# Altium project LattePanda.PrjPcb (part 2 of 2)
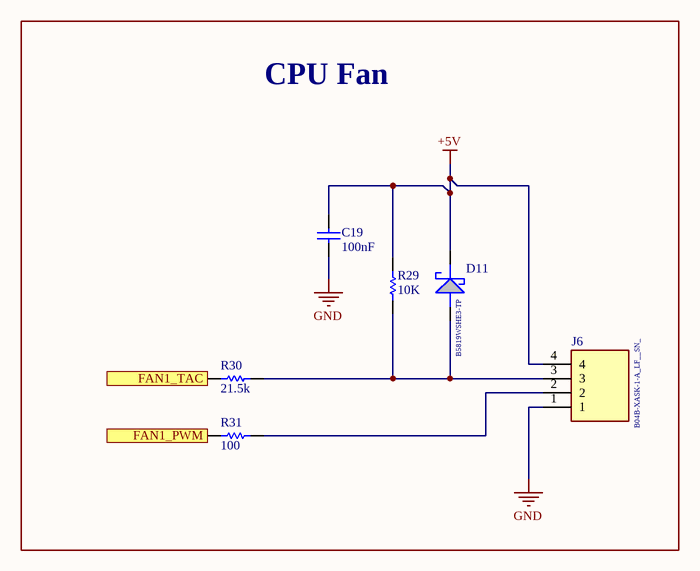
[diagram p9: [3] Fan.SchDoc]

## Nets that join several sheets
+3V3: [1] Conn_SODIMM (10 pins), [2] Power_Supply (7 pins), [5] Ethernet (12 pins), [7] Mini_HDMI (Q5.1 R49.1 R50.1 R51.1), [8] Sockets (11 pins)
+5V: [2] Power_Supply (6 pins), [6] USB (8 pins), [7] Mini_HDMI (C52.2 D12.2 F5.2), [3] Fan (C19.2 D11.1 J6.4 R29.2)
+VCC: [1] Conn_SODIMM (J3.250), [2] Power_Supply (13 pins)
GND: [1] Conn_SODIMM (7 pins), [2] Power_Supply (43 pins), [5] Ethernet (19 pins), [6] USB (25 pins), [7] Mini_HDMI (14 pins), [8] Sockets (11 pins), [3] Fan (C19.1 J6.1)
NetC30_2: [1] Conn_SODIMM (J3.63), [5] Ethernet (C30.2)
NetC31_2: [1] Conn_SODIMM (J3.61), [5] Ethernet (C31.2)
NetC32_2: [1] Conn_SODIMM (J3.66), [5] Ethernet (C32.2)
NetC33_2: [1] Conn_SODIMM (J3.64), [5] Ethernet (C33.2)
NetC57_2: [1] Conn_SODIMM (J3.31), [8] Sockets (C57.2)
NetC58_2: [1] Conn_SODIMM (J3.33), [8] Sockets (C58.2)
NetC59_2: [1] Conn_SODIMM (J3.25), [8] Sockets (C59.2)
NetC60_2: [1] Conn_SODIMM (J3.27), [8] Sockets (C60.2)
NetJ3_2: [1] Conn_SODIMM (J3.2), [3] Fan (R31.1)
NetJ3_4: [1] Conn_SODIMM (J3.4), [3] Fan (R30.1)
NetJ3_28: [1] Conn_SODIMM (J3.28), [8] Sockets (J11.43)
NetJ3_30: [1] Conn_SODIMM (J3.30), [8] Sockets (J11.41)
NetJ3_34: [1] Conn_SODIMM (J3.34), [8] Sockets (J12.41)
NetJ3_36: [1] Conn_SODIMM (J3.36), [8] Sockets (J12.43)
NetJ3_76: [1] Conn_SODIMM (J3.76), [8] Sockets (J12.3)
NetJ3_78: [1] Conn_SODIMM (J3.78), [8] Sockets (J12.5)
NetJ3_85: [1] Conn_SODIMM (J3.85), [8] Sockets (J11.55)
NetJ3_87: [1] Conn_SODIMM (J3.87), [8] Sockets (J11.53)
NetJ3_88: [1] Conn_SODIMM (J3.88), [8] Sockets (J12.47)
NetJ3_90: [1] Conn_SODIMM (J3.90), [8] Sockets (J12.49)
NetJ3_94: [1] Conn_SODIMM (J3.94), [5] Ethernet (U11.15)
NetJ3_96: [1] Conn_SODIMM (J3.96), [5] Ethernet (U11.16)
NetJ3_131: [1] Conn_SODIMM (J3.131), [8] Sockets (R60.1)
NetJ3_169: [1] Conn_SODIMM (J3.169), [7] Mini_HDMI (Q4.3 R49.2)
NetJ3_171: [1] Conn_SODIMM (J3.171), [7] Mini_HDMI (Q3.3 R50.2)
NetJ3_183: [1] Conn_SODIMM (J3.183), [7] Mini_HDMI (Q5.3 R51.2)
PLTRST: [1] Conn_SODIMM (J3.105), [5] Ethernet (U11.19), [8] Sockets (J11.50 J12.52)
PWR_LED/PSON: [1] Conn_SODIMM (J3.5), [2] Power_Supply (R20.2), [7] Mini_HDMI (R46.1)
PWR_SW: [1] Conn_SODIMM (J3.1), [2] Power_Supply (R27.2)
RST_SW: [1] Conn_SODIMM (J3.3), [2] Power_Supply (R28.2)
STDA_SSRX1_N: [1] Conn_SODIMM (J3.18), [6] USB (J8.5 U14.1)
STDA_SSRX1_P: [1] Conn_SODIMM (J3.16), [6] USB (J8.6 U14.2)
STDA_SSRX2_N: [1] Conn_SODIMM (J3.24), [6] USB (J8.14 U14.4)
STDA_SSRX2_P: [1] Conn_SODIMM (J3.22), [6] USB (J8.15 U14.5)
TMD_CK_N: [1] Conn_SODIMM (J3.197), [7] Mini_HDMI (C51.2)
TMD_CK_P: [1] Conn_SODIMM (J3.199), [7] Mini_HDMI (C50.2)
TMD_D0_N: [1] Conn_SODIMM (J3.203), [7] Mini_HDMI (C49.2)
TMD_D0_P: [1] Conn_SODIMM (J3.205), [7] Mini_HDMI (C48.2)
TMD_D1_N: [1] Conn_SODIMM (J3.209), [7] Mini_HDMI (C47.2)
TMD_D1_P: [1] Conn_SODIMM (J3.211), [7] Mini_HDMI (C46.2)
TMD_D2_N: [1] Conn_SODIMM (J3.215), [7] Mini_HDMI (C45.2)
TMD_D2_P: [1] Conn_SODIMM (J3.217), [7] Mini_HDMI (C44.2)
USB2_D1_N: [1] Conn_SODIMM (J3.79), [6] USB (J9.2 U12.5)
USB2_D1_P: [1] Conn_SODIMM (J3.81), [6] USB (J9.3 U12.4)
USB2_D2_N: [1] Conn_SODIMM (J3.109), [6] USB (J9.6 U12.2)
USB2_D2_P: [1] Conn_SODIMM (J3.111), [6] USB (J9.7 U12.1)
USB3_D1_N: [1] Conn_SODIMM (J3.67), [6] USB (J8.2 U15.2)
USB3_D1_P: [1] Conn_SODIMM (J3.69), [6] USB (J8.3 U16.2)
USB3_D2_N: [1] Conn_SODIMM (J3.73), [6] USB (J8.11 U17.2)
USB3_D2_P: [1] Conn_SODIMM (J3.75), [6] USB (J8.12 U18.2)
USB3_SSTX_N: [1] Conn_SODIMM (J3.15), [6] USB (C41.2)
USB3_SSTX_P: [1] Conn_SODIMM (J3.13), [6] USB (C42.2)
USB4_SSTX_N: [1] Conn_SODIMM (J3.21), [6] USB (C40.2)
USB4_SSTX_P: [1] Conn_SODIMM (J3.19), [6] USB (C43.2)
WAKE: [1] Conn_SODIMM (J3.103), [8] Sockets (J11.54 J12.55)